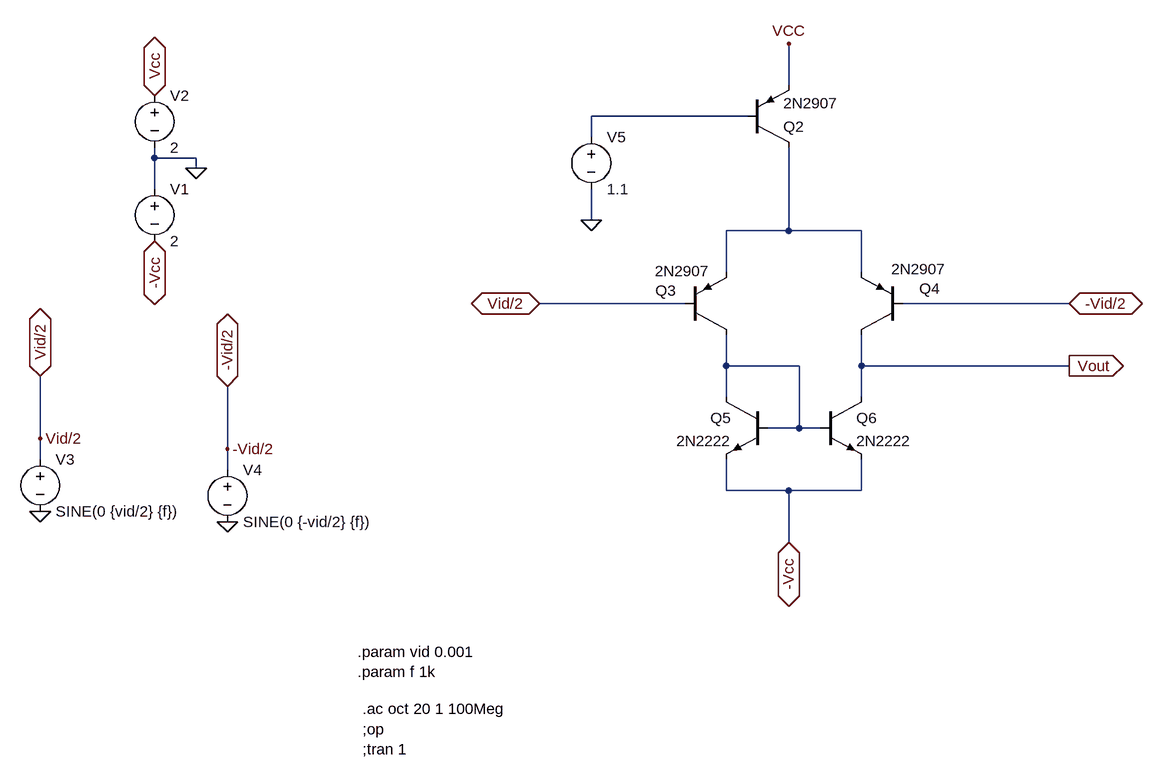
[diagram p0: schematic final_lab.asc]
final_lab.asc, the LTspice schematic file:
Version 4
SHEET 1 2336 816
WIRE 1200 -240 1200 -304
WIRE 1136 -192 896 -192
WIRE 896 -160 896 -192
WIRE 224 -128 224 -144
WIRE 288 -128 224 -128
WIRE 288 -112 288 -128
WIRE 224 -80 224 -128
WIRE 896 -32 896 -80
WIRE 1200 -16 1200 -144
WIRE 1200 -16 1104 -16
WIRE 1312 -16 1200 -16
WIRE 1104 48 1104 -16
WIRE 1312 48 1312 -16
WIRE 1040 96 816 96
WIRE 1632 96 1376 96
WIRE 1104 192 1104 144
WIRE 1216 192 1104 192
WIRE 1312 192 1312 144
WIRE 1632 192 1312 192
WIRE 1104 240 1104 192
WIRE 1312 240 1312 192
WIRE 1216 288 1216 192
WIRE 1216 288 1168 288
WIRE 1248 288 1216 288
WIRE 48 304 48 208
WIRE 336 320 336 224
WIRE 48 336 48 304
WIRE 336 352 336 320
WIRE 1104 384 1104 336
WIRE 1200 384 1104 384
WIRE 1312 384 1312 336
WIRE 1312 384 1200 384
WIRE 1200 464 1200 384
FLAG 288 -112 0
FLAG 224 0 -Vcc
IOPIN 224 0 BiDir
FLAG 224 -224 Vcc
IOPIN 224 -224 BiDir
FLAG 48 416 0
FLAG 48 304 Vid/2
FLAG 1632 192 Vout
IOPIN 1632 192 Out
FLAG 336 432 0
FLAG 336 320 -Vid/2
FLAG 48 208 Vid/2
IOPIN 48 208 BiDir
FLAG 336 224 -Vid/2
IOPIN 336 224 BiDir
FLAG 816 96 Vid/2
IOPIN 816 96 BiDir
FLAG 1632 96 -Vid/2
IOPIN 1632 96 BiDir
FLAG 1200 464 -Vcc
IOPIN 1200 464 BiDir
FLAG 1200 -304 VCC
FLAG 896 -32 0
SYMBOL Voltage 224 -96 R0
SYMATTR InstName V1
SYMATTR Value 2
SYMBOL Voltage 224 -240 R0
WINDOW 123 0 0 Left 0
WINDOW 39 0 0 Left 0
SYMATTR InstName V2
SYMATTR Value 2
SYMBOL Voltage 48 320 R0
SYMATTR InstName V3
SYMATTR Value SINE(0 {vid/2} {f})
SYMATTR Value2 AC {vid/2}
SYMBOL npn 1168 240 M0
SYMATTR InstName Q5
SYMATTR Value 2N2222
SYMBOL npn 1248 240 R0
SYMATTR InstName Q6
SYMATTR Value 2N2222
SYMBOL pnp 1040 144 M180
WINDOW 0 -45 68 Left 2
WINDOW 3 -46 98 Left 2
SYMATTR InstName Q3
SYMATTR Value 2N2907
SYMBOL pnp 1376 144 R180
WINDOW 0 -57 71 Left 2
WINDOW 3 -67 101 Left 2
SYMATTR InstName Q4
SYMATTR Value 2N2907
SYMBOL Voltage 336 336 R0
SYMATTR InstName V4
SYMATTR Value SINE(0 {-vid/2} {f})
SYMATTR Value2 AC {-vid/2}
SYMBOL pnp 1136 -144 M180
SYMATTR InstName Q2
SYMATTR Value 2N2907
SYMBOL voltage 896 -176 R0
WINDOW 123 0 0 Left 0
WINDOW 39 0 0 Left 0
SYMATTR InstName V5
SYMATTR Value 1.1
TEXT 536 632 Left 2 !.param vid 0.001\n.param f 1k
TEXT 544 720 Left 2 !.ac oct 20 1 100Meg\n;op\n;tran 1

The netlist it stands for:
* final_lab.asc
V1 0 -Vcc 2
V2 Vcc 0 2
V3 Vid/2 0 SINE(0 {vid/2} {f}) AC {vid/2}
Q5 N003 N003 -Vcc 0 2N2222
Q6 Vout N003 -Vcc 0 2N2222
Q3 N003 Vid/2 N002 0 2N2907
Q4 Vout -Vid/2 N002 0 2N2907
V4 -Vid/2 0 SINE(0 {-vid/2} {f}) AC {-vid/2}
Q2 N002 N001 Vcc 0 2N2907
V5 N001 0 1.1
.model NPN NPN
.model PNP PNP
.lib standard.bjt
.param vid 0.001
.param f 1k
.ac oct 20 1 100Meg
;op
;tran 1
.backanno
.end